# Altium project A4_USB.PrjPcb
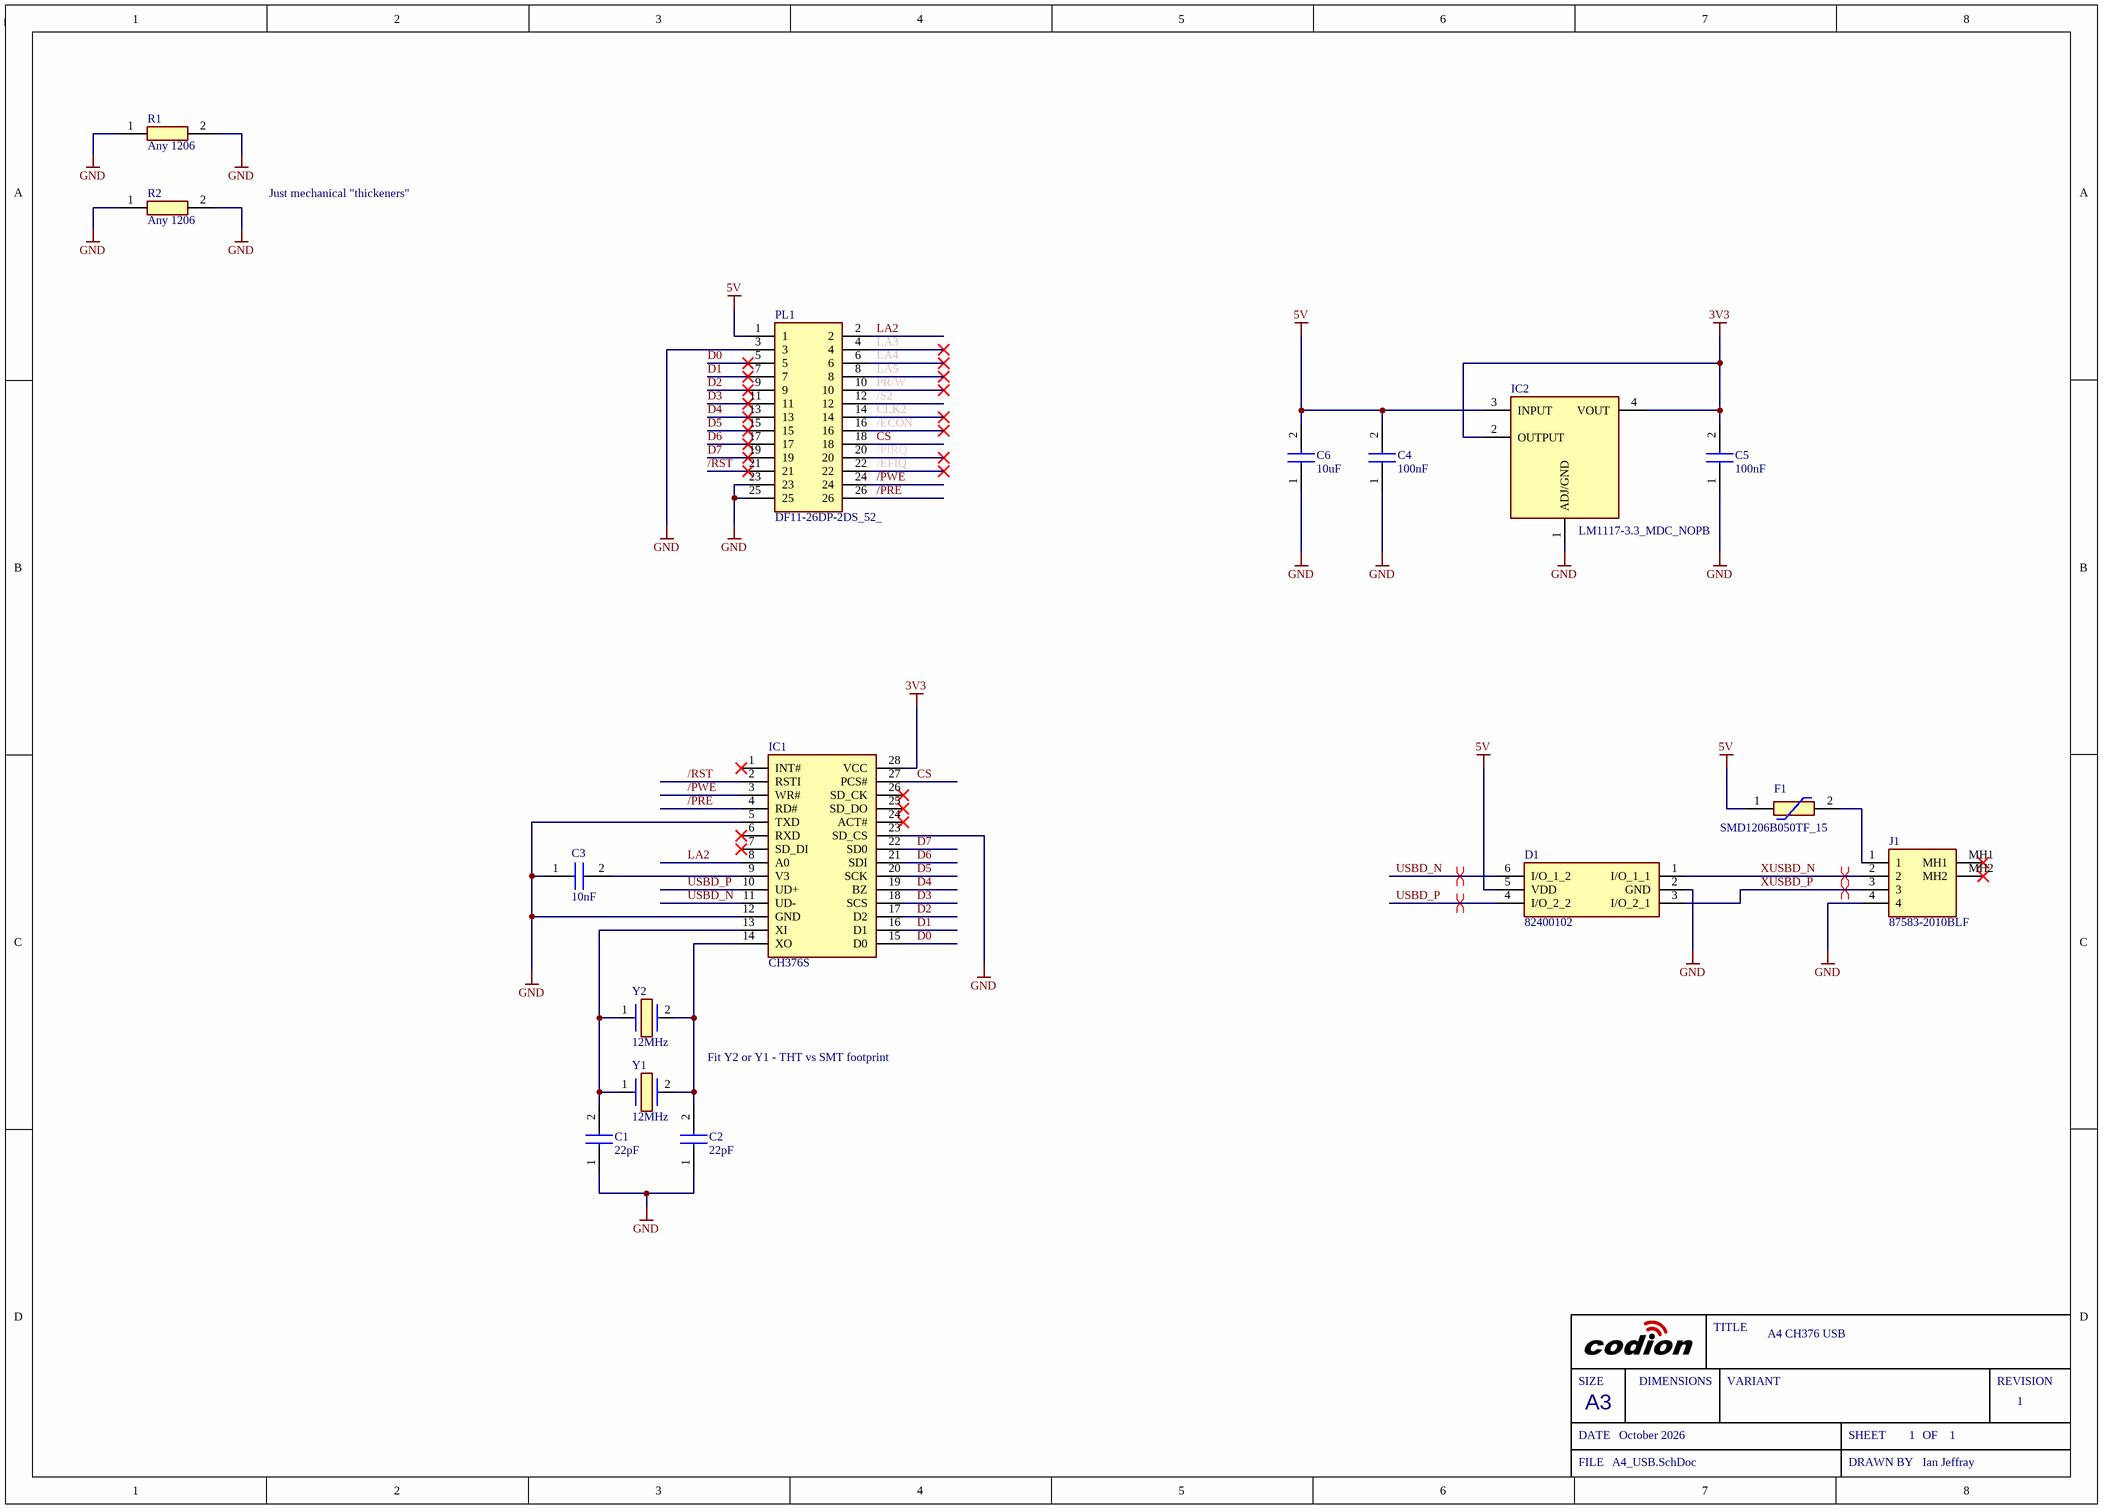
[diagram p0: A4_USB.SchDoc]
Sch_RevNo: 1; Sch_ReleaseDate: October 2026; Project_Title: A4 CH376 USB; PCB_RevNo: 1.0; DrawnBy: Ian Jeffray
1 sheet, 16 parts. Net scope: global (net labels, ports and power ports of the same name join across sheets).
Board file: A4_USB.PcbDoc

## Sheet A4_USB.SchDoc
size A3; SheetNumber: 1; SheetTotal: 1

### Parts
C1  22pF  [CAPC1608X87N]
C2  22pF  [CAPC1608X87N]
C3  10nF  [C0603]
C4  100nF  [C0603]
C5  100nF  [C0603]
C6  10uF  [CAPC2012X145N]
D1  82400102  [SOT95P280X116-6N]
F1  SMD1206B050TF_15  [FUSC3216X115N]
IC1  CH376S  [SOIC127P1032X264-28N]
IC2  LM1117-3.3_MDC_NOPB  [SOT230P700X180-4N]
J1  87583-2010BLF  [875832010BLF]
PL1  DF11-26DP-2DS_52_  [SHDRRA26W50P200_2X13_2800X1000X500P]
R1  Any 1206  [RESC3116X65N]
R2  Any 1206  [RESC3116X65N]
Y1  12MHz  [ABLS]
Y2  12MHz  [ABL]

### Nets
3V3: C5.2 IC1.28(VCC) IC2.2(OUTPUT) IC2.4(VOUT)
5V: C4.2 C6.2 D1.5(VDD) F1.1 IC2.3(INPUT) PL1.1
GND: C1.1 C2.1 C3.1 C4.1 C5.1 C6.1 D1.2(GND) IC1.5(TXD) IC1.12(GND) IC1.23(SD_CS) IC2.1(ADJ/GND) J1.4 PL1.3 PL1.23 PL1.25 R1.1 R1.2 R2.1 R2.2
/ECON: PL1.16
/EFIQ: PL1.22
/PIRQ: PL1.20
/PRE: IC1.4(RD#) PL1.26
/PWE: IC1.3(WR#) PL1.24
/RST: IC1.2(RSTI) PL1.21
/S2: PL1.12
CLK2: PL1.14
CS: IC1.27(PCS#) PL1.18
D0: IC1.15(D0) PL1.5
D1: IC1.16(D1) PL1.7
D2: IC1.17(D2) PL1.9
D3: IC1.18(SCS) PL1.11
D4: IC1.19(BZ) PL1.13
D5: IC1.20(SCK) PL1.15
D6: IC1.21(SDI) PL1.17
D7: IC1.22(SD0) PL1.19
LA2: IC1.8(A0) PL1.2
LA3: PL1.4
LA4: PL1.6
LA5: PL1.8
PR/W: PL1.10
USBD_N: D1.6(I/O_1_2) IC1.11(UD-)
USBD_P: D1.4(I/O_2_2) IC1.10(UD+)
XUSBD_N: D1.1(I/O_1_1) J1.2
XUSBD_P: D1.3(I/O_2_1) J1.3
NetC1_2: C1.2 IC1.13(XI) Y1.1 Y2.1
NetC2_2: C2.2 IC1.14(XO) Y1.2 Y2.2
NetC3_2: C3.2 IC1.9(V3)
NetF1_2: F1.2 J1.1

Not connected (* = marked no-connect by the designer): IC1 1(INT#)* 6(RXD)* 7(SD_DI)* 24(ACT#)* 25(SD_DO)* 26(SD_CK)*; J1 MH1* MH2*

### Layout directives
differential pair: USBD_N, USBD_P, XUSBD_N, XUSBD_P

### Notes on the sheet
- Just mechanical "thickeners"
- Fit Y2 or Y1 - THT vs SMT footprint
- SIZE
- DIMENSIONS
- TITLE
- VARIANT
- REVISION
- DATE
- A3
- SHEET
- OF
- FILE
- DRAWN BY

### Library data of the parts
C1 C2 = C0603C220J1GACTU: Capacitor; Manufacturer_Name: Yageo Group; Datasheet Link: https://www.yageogroup.com/content/datasheet/asset/file/KEM_C1003_C0G_SMD; Height: 0.87mm; Manufacturer_Part_Number: C0603C220J1GACTU; Mouser Part Number: 80-C0603C220J1G; Mouser Price/Stock: https://www.mouser.co.uk/ProductDetail/KEMET/C0603C220J1GACTU?qs=HptsreX1S%2F74iVK3hnCGwA%3D%3D; Arrow Part Number: C0603C220J1GACTU; Arrow Price/Stock: https://www.arrow.com/en/products/c0603c220j1gactu/kemet-corporation
C3 = C0603C103K4RECTU: Capacitor; Manufacturer_Name: KEMET; Datasheet Link: https://content.kemet.com/datasheets/KEM_C1090_X7R_ESD.pdf; Height: 0.87mm; Manufacturer_Part_Number: C0603C103K4RECTU; Mouser Part Number: 80-C0603C103K4RECTU; Mouser Price/Stock: https://www.mouser.co.uk/ProductDetail/KEMET/C0603C103K4RECTU?qs=55YtniHzbhDzGaFFpCm8vg%3D%3D; Arrow Part Number: C0603C103K4RECTU; Arrow Price/Stock: https://www.arrow.com/en/products/c0603c103k4rectu/kemet-corporation?region=nac
C4 C5 = C0603C104Z4VAC7411: Capacitor; Manufacturer_Name: Yageo Group; Datasheet Link: https://content.kemet.com/datasheets/KEM_C1005_Y5V_SMD.pdf; Height: 0.87mm; Manufacturer_Part_Number: C0603C104Z4VAC7411; Mouser Part Number: 80-C0603C104Z4VACLR; Mouser Price/Stock: https://www.mouser.co.uk/ProductDetail/KEMET/C0603C104Z4VAC7411?qs=t9q%2F2xDdjt%2FYD2OroS%2FhSQ%3D%3D
C6 = GRM21BR61E106MA73L: Capacitor; Manufacturer_Name: Murata Electronics; Datasheet Link: https://search.murata.co.jp/Ceramy/image/img/A01X/G101/ENG/GRM21BR61E106MA73-01A.pdf; Height: 1.45mm; Manufacturer_Part_Number: GRM21BR61E106MA73L; Mouser Part Number: 81-GRM21BR61E106MA3L; Mouser Price/Stock: https://www.mouser.co.uk/ProductDetail/Murata-Electronics/GRM21BR61E106MA73L?qs=2W5sgKM%2F371odLMyCilkag%3D%3D; Arrow Part Number: GRM21BR61E106MA73L; Arrow Price/Stock: https://www.arrow.com/en/products/grm21br61e106ma73l/murata-manufacturing?utm_currency=USD&region=nac
D1 = 82400102: Diode; Manufacturer_Name: Wurth Elektronik; Datasheet Link: https://www.we-online.com/catalog/datasheet/82400102.pdf; Height: 1.16mm; Manufacturer_Part_Number: 82400102; Mouser Part Number: 710-82400102; Mouser Price/Stock: https://www.mouser.co.uk/ProductDetail/Wurth-Elektronik/82400102?qs=Wn16VcyqZWq4x2NXBP4V%252Bw%3D%3D
F1 = SMD1206B050TF_15: Resettable Fuse; Manufacturer_Name: Yageo Group; Manufacturer_Part_Number: SMD1206B050TF/15; Datasheet Link: https://www.yageogroup.com/content/datasheet/asset/file/SMD1206_1; Height: 1.15mm; Mouser Part Number: 603-SMD1206B050TF/15; Mouser Price/Stock: https://www.mouser.co.uk/ProductDetail/YAGEO/SMD1206B050TF-15?qs=PzGy0jfpSMtHs3qJt7INeg%3D%3D; Arrow Part Number: SMD1206B050TF/15; Arrow Price/Stock: https://www.arrow.com/en/products/smd1206b050tf15/yageo?utm_currency=USD&region=nac
IC1 = CH376S: Integrated Circuit; Manufacturer_Name: Microsemi Corporation; Datasheet Link: https://www.mpja.com/download/ch376ds1.pdf; Height: 2.64mm; Manufacturer_Part_Number: CH376S
IC2 = LM1117-3.3_MDC_NOPB: Integrated Circuit; Manufacturer_Name: Texas Instruments; Manufacturer_Part_Number: LM1117-3.3 MDC/NOPB; Datasheet Link: http://www.ti.com/lit/ds/symlink/lm1117.pdf?HQS=TI-null-null-mousermode-df-pf-null-wwe&DCM=yes&ref_url=https%3A%2F%2Fwww.mouser.in%2F&distId=26; Height: 1.8mm; Mouser Part Number: N/A; Mouser Price/Stock: https://www.mouser.co.uk/ProductDetail/Texas-Instruments/LM1117-3.3-MDC-NOPB?qs=Ek1QeT%2FBOW0pQDUjkXKTEQ%3D%3D
J1 = 87583-2010BLF: Connector; Manufacturer_Name: Amphenol Communications Solutions; Datasheet Link: https://cdn.amphenol-cs.com/media/wysiwyg/files/drawing/87583.pdf; Height: 7.94mm; Manufacturer_Part_Number: 87583-2010BLF; Arrow Part Number: 87583-2010BLF; Arrow Price/Stock: https://www.arrow.com/en/products/87583-2010blf/amphenol-fci?region=europe
PL1 = DF11-26DP-2DS_52_: Connector; Manufacturer_Name: Hirose; Manufacturer_Part_Number: DF11-26DP-2DS(52); Datasheet Link: https://www.hirose.com/product/document?clcode=CL0543-0544-8-52&productname=DF11-26DP-2DS(52)&series=DF11&documenttype=2DDrawing&lang=en&documentid=0000995291; Height: 5mm; Mouser Part Number: 798-DF11-26DP-2DS52; Mouser Price/Stock: https://www.mouser.co.uk/ProductDetail/Hirose-Connector/DF11-26DP-2DS52?qs=Ux3WWAnHpjAoQVMFZWdmwg%3D%3D; Arrow Part Number: DF11-26DP-2DS(52); Arrow Price/Stock: https://www.arrow.com/en/products/df11-26dp-2ds-52/hirose-electric
R1 R2 = CR1206AJ_-000EAS: Resistor; Manufacturer_Name: Bourns; Manufacturer_Part_Number: CR1206AJ/-000EAS; Datasheet Link: http://www.farnell.com/datasheets/2819381.pdf; Height: 0.65mm; Mouser Part Number: 652-CR1206AJ/-000EAS; Mouser Price/Stock: https://www.mouser.co.uk/ProductDetail/Bourns/CR1206AJ-000EAS?qs=PzGy0jfpSMutU5m6FlIuSA%3D%3D; Arrow Part Number: CR1206AJ/-000EAS; Arrow Price/Stock: https://www.arrow.com/en/products/cr1206aj-000eas/bourns?region=nac
Y1 = ABLS-12.000MHZ-B2Y-T: Crystal or Oscillator; Manufacturer_Name: ABRACON; Datasheet Link: https://abracon.com/Resonators/abls.pdf; Manufacturer_Part_Number: ABLS-12.000MHZ-B2Y-T; Mouser Part Number: 815-ABLS12000MHZB2YT; Mouser Price/Stock: https://www.mouser.co.uk/ProductDetail/ABRACON/ABLS-12.000MHZ-B2Y-T?qs=vmHwEFxEFR%252BA%252B0BPn15RVQ%3D%3D
Y2 = ABL-12.000MHZ-B2: Crystal or Oscillator; Manufacturer_Name: ABRACON; Datasheet Link: https://abracon.com/Resonators/ABL.pdf; Manufacturer_Part_Number: ABL-12.000MHZ-B2; Mouser Part Number: 815-ABL-12-B2; Mouser Price/Stock: https://www.mouser.co.uk/ProductDetail/ABRACON/ABL-12.000MHZ-B2?qs=zLkLEWnxMJzcerUKP0J8Mw%3D%3D; Arrow Part Number: ABL-12.000MHZ-B2; Arrow Price/Stock: https://www.arrow.com/en/products/abl-12.000mhz-b2/abracon?region=nac